# Altium schematic sheet Main_Sheet.SchDoc
size A4; SheetNumber: 1; SheetTotal: 1
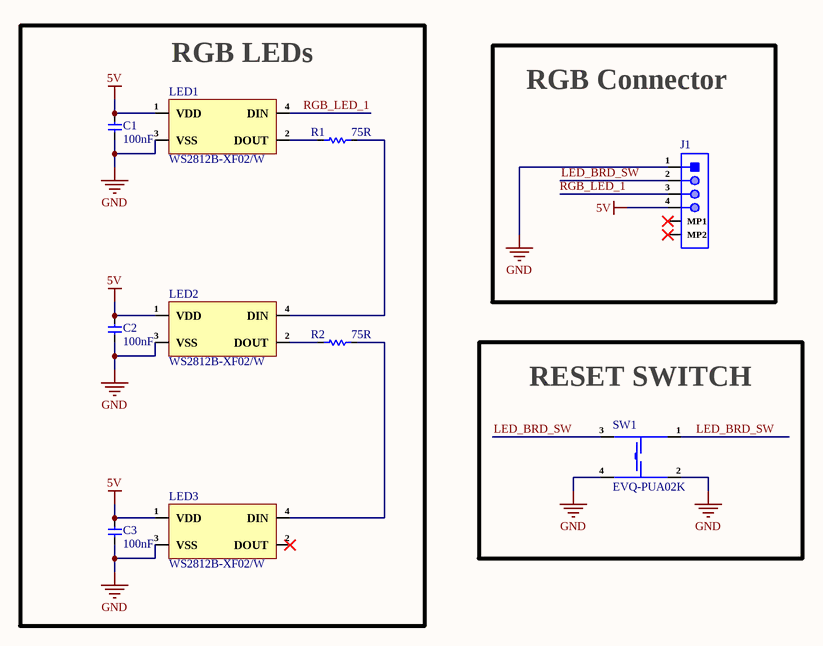
[diagram p0: Main_Sheet.SchDoc]

## Parts
C1  100nF  [Cap-0402]
C2  100nF  [Cap-0402]
C3  100nF  [Cap-0402]
J1  SM04B-SRSS-TB(LF)(SN)  [SM04B-SRSS-TB(LF)(SN)]  (value not drawn)
LED1  WS2812B-XF02/W  [WS2812B-XF02/W]
LED2  WS2812B-XF02/W  [WS2812B-XF02/W]
LED3  WS2812B-XF02/W  [WS2812B-XF02/W]
R1  75R  [Res-0402]
R2  75R  [Res-0402]
SW1  EVQ-PUA02K  [EVQPUA02K]

## Blocks framed on the sheet
RGB LEDs: C1-C3 LED1-LED3 R1 R2
RGB Connector: J1
RESET SWITCH: SW1

## Nets
5V: C1.2 C2.2 C3.2 J1.4 LED1.1(VDD) LED2.1(VDD) LED3.1(VDD)
GND: C1.1 C2.1 C3.1 J1.1 LED1.3(VSS) LED2.3(VSS) LED3.3(VSS) SW1.2 SW1.4
LED_BRD_SW: J1.2 SW1.1 SW1.3
RGB_LED_1: J1.3 LED1.4(DIN)
NetLED1_2: LED1.2(DOUT) R1.1
NetLED2_2: LED2.2(DOUT) R2.1
NetLED2_4: LED2.4(DIN) R1.2
NetLED3_4: LED3.4(DIN) R2.2

Not connected (* = marked no-connect by the designer): J1 MP1* MP2*; LED3 2(DOUT)*

## Notes on the sheet
- File:
- Title:
- Date:
- Page
- Num:
- Total:
- Drawn By: Huzaifa Ali

## Library data of the parts
C1-C3 = CC0402KRX5R8BB104: CAP CER 0.1UF 25V X5R 0402; Manufacturer: Yageo; Tolerance: 10%; Item Type: Capacitor; Supplier 1: Digi-Key; Manufacturer Part Number: CC0402KRX5R8BB104; RoHS: Yes; Category: Ceramic Capacitors; Stock 1: 4598218; Pricing 1: 1=0.10000, 10=0.03800, 50=0.02100, 100=0.01710, 500=0.01224, 1000=0.00961, 2500=0.00874, 5000=0.00804 (USD); Mount: Surface Mount; Case/Package: 0402; Case Code (Metric): 1005; Case Code (Imperial): 0402; Min Operating Temperature: -55°C; Max Operating Temperature: 85°C; Voltage Rating: 25V; Packaging: Tape and Reel; Capacitance: 100nF; Voltage Rating (DC): 25V; Dielectric: X5R; Resistor Type: Ceramic; Series: CC; Length: 0.039inch; Width: 0.02inch; Thickness: 0.022inch; Depth: 0.5mm; Lead Free: Lead Free; Halogen Free: Halogen Free; RoHS Compliant: Yes; ComponentLink1URL: http://www.mouser.com/ds/2/447/UPY-GPHC_X5R_4V-to-50V_25-1131599.pdf?src-supplier=Mouser; ComponentLink1Description: http://www.mouser.com/ds/2/447/UPY-GPHC_X5R_4V-to-50V_25-1131599.pdf?src-supplier=Mouser; ComponentLink2URL: http://www.yageo.com/documents/recent/UPY-GPHC_X5R_4V-to-50V-16.pdf?src-supplier=Future+Electronics; ComponentLink2Description: http://www.yageo.com/documents/recent/UPY-GPHC_X5R_4V-to-50V-16.pdf?src-supplier=Future+Electronics; ComponentLink3URL: http://www.yageo.com/documents/recent/UPY-GPHC_X5R_4V-to-50V_25.pdf?src-supplier=Digi-Key; ComponentLink3Description: http://www.yageo.com/documents/recent/UPY-GPHC_X5R_4V-to-50V_25.pdf?src-supplier=Digi-Key; Supplier Part Number 1: 311-1697-1-ND; LCSC Part Number: C106256
J1 = SM04B-SRSS-TB(LF)(SN): CONN HEADER SMD R/A 4POS 1MM; Manufacturer: JST; Item Type: Headers and Wire Housings; Voltage Rating: 50V; Number of Contacts: 4NUMBER; Contact Resistance: 40mR; Max Current Rating: 1A; Number of Positions: 4; Supplier: Future Electronics; LCSC Part Number: C160404; Manufacturer Part Number: SM04B-SRSS-TB(LF)(SN); RoHS: Yes; Stock: 27000; Pricing: 3000=0.285, 6000=0.275 (USD); Mounting Technology: Surface Mount; Contact Material: Copper Alloy; Contact Plating: Copper,Tin; Housing Color: Beige; Housing Material: Polyamide; Contact Shape: Square; Contact Finish - Mating: TIN; Insulation Material: Nylon; Insulation Color: Natural; Min Operating Temperature: -25°C; Max Operating Temperature: 85°C; Number of Rows: 1; Termination: Solder; Orientation: Right Angle; Packaging: Tape and Reel; Max Voltage Rating (AC): 50V; Max Voltage Rating (DC): 50V; Connector Type: Header; Fastening Type: Pull; Series: SR; Contact Type: Male Pin; Length: 6mm; Pitch: 1mm; Depth: 4.95mm; Flammability Rating: UL94 V-0; ComponentLink1URL: https://datasheet.ciiva.com/26894/getdatasheetpartid-640736-26894676.pdf?src-supplier=Verical; ComponentLink1Description: https://datasheet.ciiva.com/26894/getdatasheetpartid-640736-26894676.pdf?src-supplier=Verical; ComponentLink2URL: https://datasheet.ciiva.com/26894/getdatasheetpartid-499363-26894945.pdf?src-supplier=Verical; ComponentLink2Description: https://datasheet.ciiva.com/26894/getdatasheetpartid-499363-26894945.pdf?src-supplier=Verical; ComponentLink3URL: https://datasheet.ciiva.com/16487/jstsm04b-srss-tb-lf-sn-16487222.pdf?src-supplier=Future+Electronics; ComponentLink3Description: https://datasheet.ciiva.com/16487/jstsm04b-srss-tb-lf-sn-16487222.pdf?src-supplier=Future+Electronics
LED1-LED3 = WS2812B-XF02/W: SMD5050 Light Emitting Diodes (LED) ROHS; Manufacturer: Worldsemi; Item Type: RGB LED; Manufacturer Part Number: WS2812B-XF02/W; Package: SMD5050; LCSC Part Number: C4154882; ComponentLink1Description: LCSC; ComponentLink1URL: https://www.lcsc.com/product-detail/Light-Emitting-Diodes-LED_Worldsemi-WS2812B-XF02-W_C4154882.html
R1 R2 = RC0402JR-0775RL: RES 75 OHM 5% 1/16W 0402; Manufacturer: Yageo; Item Type: Resistor; Temperature Coefficient: 100ppm/°C; Power Rating: 62.5mW; Voltage Rating: 50V; Max Power Dissipation: 63mW; Supplier: Digikey; Supplier Part Number: 311-75JRCT-ND; Manufacturer Part Number: RC0402JR-0775RL; RoHS: Yes; Stock: 2993323; Pricing: 1=0.1, 10=0.018, 50=0.0102, 100=0.0083, 500=0.00528, 1000=0.00444, 5000=0.00307 (USD); Case/Package: 0402; Pins: 2; Contact Plating: Tin,Lead; Case Code (Imperial): 0402; Case Code (Metric): 1005; Min Operating Temperature: -55°C; Max Operating Temperature: 155°C; Value: 75R; Tolerance: 5%; Resistor Type: Thick Film; Packaging: Tape and Reel; Termination: SMD/SMT; Voltage Rating (DC): 50V; Features: Moisture Resistant; Series: RC; Number of Terminations: 2; Resistance Tolerance: 5%; Length: 1mm; Width: 0.5mm; Height: 0.35mm; Reach SVHC Compliant: No; Lead Free: Lead Free; RoHS Compliant: Yes; ComponentLink1URL: https://datasheet.ciiva.com/7983/1018594-7983612.pdf?src-supplier=Element14; ComponentLink1Description: https://datasheet.ciiva.com/7983/1018594-7983612.pdf?src-supplier=Element14; ComponentLink2URL: https://datasheet.ciiva.com/17082/pyu-rc0402-51-rohs-l-6-r-17082239.pdf?src-supplier=Future+Electronics; ComponentLink2Description: https://datasheet.ciiva.com/17082/pyu-rc0402-51-rohs-l-6-r-17082239.pdf?src-supplier=Future+Electronics; LCSC Part Number: C137841
SW1 = EVQ-PUA02K: SWITCH TACTILE SPST-NO 0.05A 12V; Manufacturer: Panasonic; Mechanical Life: 100000Cycles; Actuator Color: Black; Operating Force: 2.2N; Throw Configuration: SPST; Max Current Rating: 50mA; Contact Resistance: 500mR; Illumination Type: Non-Illuminated,Illuminated; Switch Travel: 0.3mm; Switch Function: Off-Mom; Number of Positions: 2NUMBER; Actuator Length: 1mm; Item Type: Tactile Switch; Supplier: Mouser; LCSC Part Number: C128539; Manufacturer Part Number: EVQ-PUA02K; RoHS: Yes; Category: Tactile Switches; Stock: 6621; Pricing: 1=0.52, 10=0.461, 50=0.461, 100=0.384, 1000=0.335, 10000=0.283 (USD); Mounting Technology: Surface Mount; Min Operating Temperature: -20°C; Max Operating Temperature: 70°C; Max Voltage Rating (DC): 12V; Termination: Gull Wing; Packaging: Tape and Reel; Package Quantity: 4000; Current Rating: 50mA; Voltage Rating (DC): 12V; Electrical Life: 100000Cycles; Contact Current Rating: 50mA; Orientation: Straight; Series: EVQPU; Length: 6.4mm; Depth: 4.5mm; Radiation Hardening: No; RoHS Compliant: Yes; ComponentLink1URL: https://datasheet.ciiva.com/30117/atv0000ce5-30117313.pdf?src-supplier=Onlinecomponents.com; ComponentLink1Description: https://datasheet.ciiva.com/30117/atv0000ce5-30117313.pdf?src-supplier=Onlinecomponents.com; ComponentLink2URL: https://datasheet.ciiva.com/26945/getdatasheetpartid-65575-26945772.pdf?src-supplier=Verical; ComponentLink2Description: https://datasheet.ciiva.com/26945/getdatasheetpartid-65575-26945772.pdf?src-supplier=Verical; ComponentLink3URL: https://datasheet.ciiva.com/7987/1679731-7987639.pdf?src-supplier=Element14; ComponentLink3Description: https://datasheet.ciiva.com/7987/1679731-7987639.pdf?src-supplier=Element14; ComponentLink4URL: https://datasheet.ciiva.com/8165/atv0000ce5-8165244.pdf?src-supplier=Avnet; ComponentLink4Description: https://datasheet.ciiva.com/8165/atv0000ce5-8165244.pdf?src-supplier=Avnet; ComponentLink5URL: https://datasheet.ciiva.com/2899/atv0000ce5-2899804.pdf?src-supplier=Digikey; ComponentLink5Description: https://datasheet.ciiva.com/2899/atv0000ce5-2899804.pdf?src-supplier=Digikey; ComponentLink6URL: https://datasheet.ciiva.com/2899/atv0000ce5-2899805.pdf?src-supplier=Digikey; ComponentLink6Description: https://datasheet.ciiva.com/2899/atv0000ce5-2899805.pdf?src-supplier=Digikey; ComponentLink7URL: https://datasheet.ciiva.com/2899/atv0000ce5-2899803.pdf?src-supplier=Digikey; ComponentLink7Description: https://datasheet.ciiva.com/2899/atv0000ce5-2899803.pdf?src-supplier=Digikey